# Altium schematic sheet Storage.SchDoc
size A4; SheetNumber: 5; SheetTotal: 7
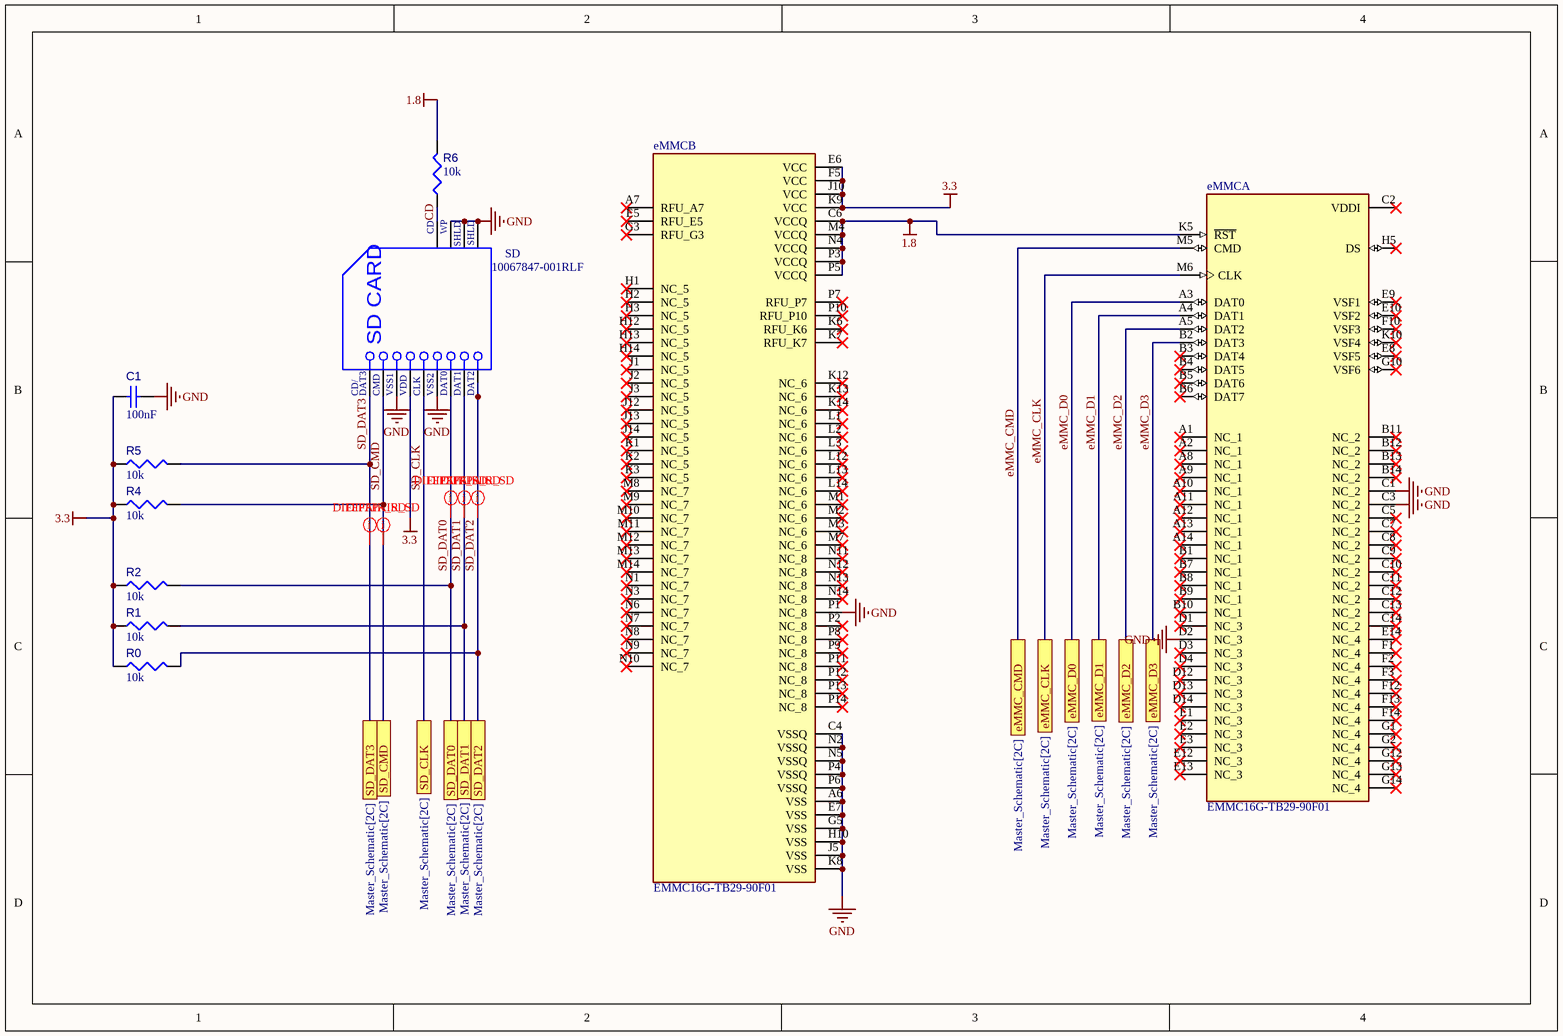
[diagram p0: Storage.SchDoc]

## Parts
C1  value 100nF  [CAPC0402(1005)60_L]  (hidden comment: Capacitor 100nF +/-20% 50V 0402)
eMMC  EMMC16G-TB29-90F01  [BGA153N50P14X14_1300X1150X100N]  (parts A,B of 2)
R0  value 10k  [RESC0402(1005)_L]  (hidden comment: 10KR2F)
R1  value 10k  [RESC0402(1005)_L]  (hidden comment: 10KR2F)
R2  value 10k  [RESC0402(1005)_L]  (hidden comment: 10KR2F)
R4  value 10k  [RESC0402(1005)_L]  (hidden comment: 10KR2F)
R5  value 10k  [RESC0402(1005)_L]  (hidden comment: 10KR2F)
R6  value 10k  [RESC0402(1005)_L]  (hidden comment: 10KR2F)
SD  10067847-001RLF  [FCI-10067847-001RLF_V]

## Ports
eMMC_CLK (see Master_Schematic[2C]), eMMC_CMD (see Master_Schematic[2C]), eMMC_D0 (see Master_Schematic[2C]), eMMC_D1 (see Master_Schematic[2C]), eMMC_D2 (see Master_Schematic[2C]), eMMC_D3 (see Master_Schematic[2C]), SD_CLK (see Master_Schematic[2C]), SD_CMD (see Master_Schematic[2C]), SD_DAT0 (see Master_Schematic[2C]), SD_DAT1 (see Master_Schematic[2C]), SD_DAT2 (see Master_Schematic[2C]), SD_DAT3 (see Master_Schematic[2C])

## Nets
1.8: eMMC.C6(VCCQ) eMMC.K5(~{RST}) eMMC.M4(VCCQ) eMMC.N4(VCCQ) eMMC.P3(VCCQ) eMMC.P5(VCCQ) R6.2
3.3: C1.1 eMMC.E6(VCC) eMMC.F5(VCC) eMMC.J10(VCC) eMMC.K9(VCC) R0.1 R1.1 R2.1 R4.1 R5.1 SD.4(VDD)
GND: C1.2 eMMC.A6(VSS) eMMC.C1(NC_2) eMMC.C3(NC_2) eMMC.C4(VSSQ) eMMC.D2(NC_3) eMMC.E7(VSS) eMMC.G5(VSS) eMMC.H10(VSS) eMMC.J5(VSS) eMMC.K8(VSS) eMMC.N2(VSSQ) eMMC.N5(VSSQ) eMMC.P1(NC_8) eMMC.P4(VSSQ) eMMC.P6(VSSQ) SD.3(VSS1) SD.6(VSS2) SD.11(WP) SD.12(SHLD1) SD.13(SHLD2)
CD: R6.1 SD.10(CD)
eMMC_CLK: eMMC.M6(CLK) ; port eMMC_CLK
eMMC_CMD: eMMC.M5(CMD) ; port eMMC_CMD
eMMC_D0: eMMC.A3(DAT0) ; port eMMC_D0
eMMC_D1: eMMC.A4(DAT1) ; port eMMC_D1
eMMC_D2: eMMC.A5(DAT2) ; port eMMC_D2
eMMC_D3: eMMC.B2(DAT3) ; port eMMC_D3
SD_CLK: SD.5(CLK) ; port SD_CLK
SD_CMD: R4.2 SD.2(CMD) ; port SD_CMD
SD_DAT0: R2.2 SD.7(DAT0) ; port SD_DAT0
SD_DAT1: R1.2 SD.8(DAT1) ; port SD_DAT1
SD_DAT2: R0.2 SD.9(DAT2) ; port SD_DAT2
SD_DAT3: R5.2 SD.1(CD/DAT3) ; port SD_DAT3

Not connected (* = marked no-connect by the designer): eMMC A1(NC_1)* A2(NC_1)* A7(RFU_A7)* A8(NC_1)* A9(NC_1)* A10(NC_1)* A11(NC_1)* A12(NC_1)* A13(NC_1)* A14(NC_1)* B1(NC_1)* B3(DAT4)* B4(DAT5)* B5(DAT6)* B6(DAT7)* B7(NC_1)* B8(NC_1)* B9(NC_1)* B10(NC_1)* B11(NC_2)* B12(NC_2)* B13(NC_2)* B14(NC_2)* C2(VDDI)* C5(NC_2)* C7(NC_2)* C8(NC_2)* C9(NC_2)* C10(NC_2)* C11(NC_2)* C12(NC_2)* C13(NC_2)* C14(NC_2)* D1(NC_3)* D3(NC_3)* D4(NC_3)* D12(NC_3)* D13(NC_3)* D14(NC_3)* E1(NC_3)* E2(NC_3)* E3(NC_3)* E5(RFU_E5)* E8(VSF5)* E9(VSF1)* E10(VSF2)* E12(NC_3)* E13(NC_3)* E14(NC_4)* F1(NC_4)* F2(NC_4)* F3(NC_4)* F10(VSF3)* F12(NC_4)* F13(NC_4)* F14(NC_4)* G1(NC_4)* G2(NC_4)* G3(RFU_G3)* G10(VSF6)* G12(NC_4)* G13(NC_4)* G14(NC_4)* H1(NC_5)* H2(NC_5)* H3(NC_5)* H5(DS)* H12(NC_5)* H13(NC_5)* H14(NC_5)* J1(NC_5)* J2(NC_5)* J3(NC_5)* J12(NC_5)* J13(NC_5)* J14(NC_5)* K1(NC_5)* K2(NC_5)* K3(NC_5)* K6(RFU_K6)* K7(RFU_K7)* K10(VSF4)* K12(NC_6)* K13(NC_6)* K14(NC_6)* L1(NC_6)* L2(NC_6)* L3(NC_6)* L12(NC_6)* L13(NC_6)* L14(NC_6)* M1(NC_6)* M2(NC_6)* M3(NC_6)* M7(NC_6)* M8(NC_7)* M9(NC_7)* M10(NC_7)* M11(NC_7)* M12(NC_7)* M13(NC_7)* M14(NC_7)* N1(NC_7)* N3(NC_7)* N6(NC_7)* N7(NC_7)* N8(NC_7)* N9(NC_7)* N10(NC_7)* N11(NC_8)* N12(NC_8)* N13(NC_8)* N14(NC_8)* P2(NC_8)* P7(RFU_P7)* P8(NC_8)* P9(NC_8)* P10(RFU_P10)* P11(NC_8)* P12(NC_8)* P13(NC_8)* P14(NC_8)*

## Layout directives
differential pair; differential pair class SD: SD_CMD, SD_DAT0, SD_DAT1, SD_DAT2, SD_DAT3

## Notes on the sheet
- (in symbol CMP-2000-05818-1) SHLD; SD CARD; CD/; DAT3

## Library data of the parts
C1 = CMP-001-00067-3: Chip Capacitor, 100nF +/-20%, 50V, 0402, Thickness 0.6 mm; Tolerance: 10%; Min Operating Temperature: -55°C; Pins: 2; Case/Package: 0402; Max Operating Temperature: 85°C; Voltage Rating: 50V; Mounting Technology: SMT
eMMC = CMP-054-000000-1: eMMC 5.1 (HS400) 153B 16GB; MF: Kingston; MP: EMMC16G-TB29-90F01; Source: EMMC16G-TB29-90F01.SchLib; Pin Count: 153; Package: None; SnapEDA_Link: https://www.snapeda.com/parts/EMMC16G-TB29-90F01/Kingston/view-part/?ref=snap; Component Type: Standard; Design Item ID: EMMC16G-TB29-90F01; Value: *; Check_prices: https://www.snapeda.com/parts/EMMC16G-TB29-90F01/Kingston/view-part/?ref=eda
R0-R2 R4-R6 = CMP-009-00066-2: 10K 0.063W 1% 0402 (1005 Metric)  SMD; Power: 63mW; Case/Package: 0402; Mounting Technology: SMT; Pins: 2; Tolerance: 1%
SD = CMP-2000-05818-1: Assembly SD Card Reader, Famale, 11 Way, -40 to 105 degC, RoHS, Tape and Reel; Manufacturer: FCI Electronics; SVHC: NoSVHC(15-Jun-2015); Connector Type: MemoryCard; No. of Contacts: 11Contacts; Datasheet Version: Rev. K, 09/2014; Datasheet URL: https://datasheet.ciiva.com/1106/10067847-1106690.pdf; Package Reference: 10067847-001RLF; Product Range: -; Contact Material: CopperAlloy; Contact Plating: GoldPlatedContacts; Package Description: 11-Pin Surface Mount Device, Body 29 x 28.5 mm; Mounting Technology: SurfaceMount; Manufacturer URL: http://portal.fciconnect.com/